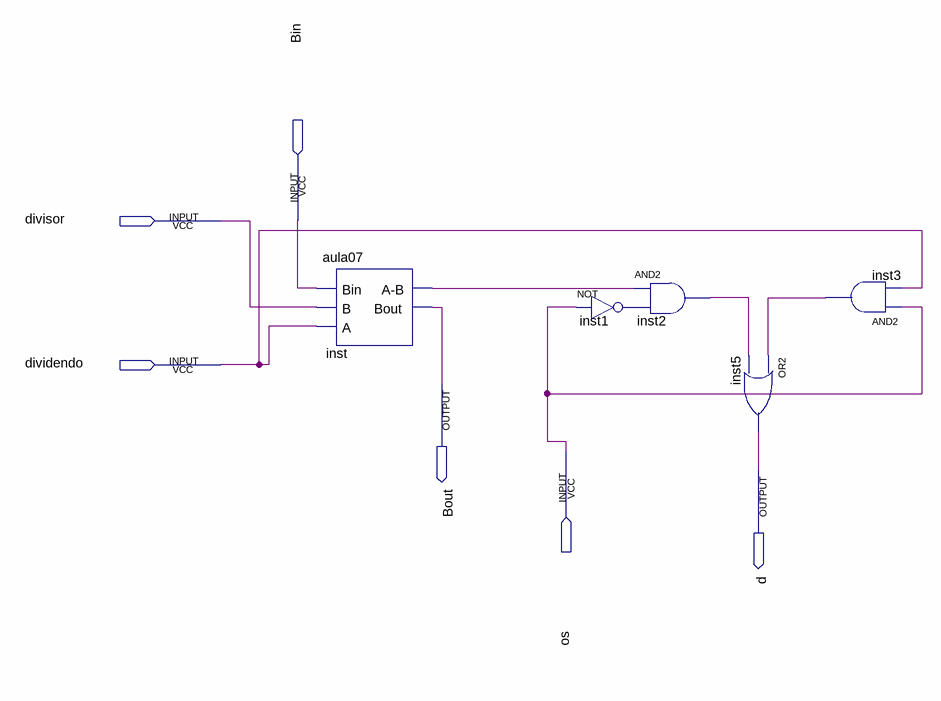
[diagram p0: schematic sheet]
// Quartus schematic unidadeDivisora.bdf as structural Verilog: 5 symbols, 6 pins
module unidadeDivisora (
  input  divisor,
  input  Bin,
  input  dividendo,
  input  os,
  output Bout,
  output d
);

  wire inst1_out, inst2_out, inst3_out, inst_a_b;

  aula07 inst (.Bin(Bin), .B(divisor), .A(dividendo), .\A-B (inst_a_b), .Bout(Bout));
  not inst1 (inst1_out, os);
  and inst2 (inst2_out, inst_a_b, inst1_out);
  or inst5 (d, inst3_out, inst2_out);
  and inst3 (inst3_out, os, dividendo);
endmodule
